# Altium schematic sheet zulu_a7_5.SchDoc
size 277 x 341 mm; Author: Christian Tambe; VERSION#: 1.0; Origin: Eagle; OriginPath: C:\Users\tambe\Documents\Electronics\Zulu_A7\Zulu_Altrium\zulu_a7.sch; OriginSheet: 6; OriginDescription: FPGA Connections
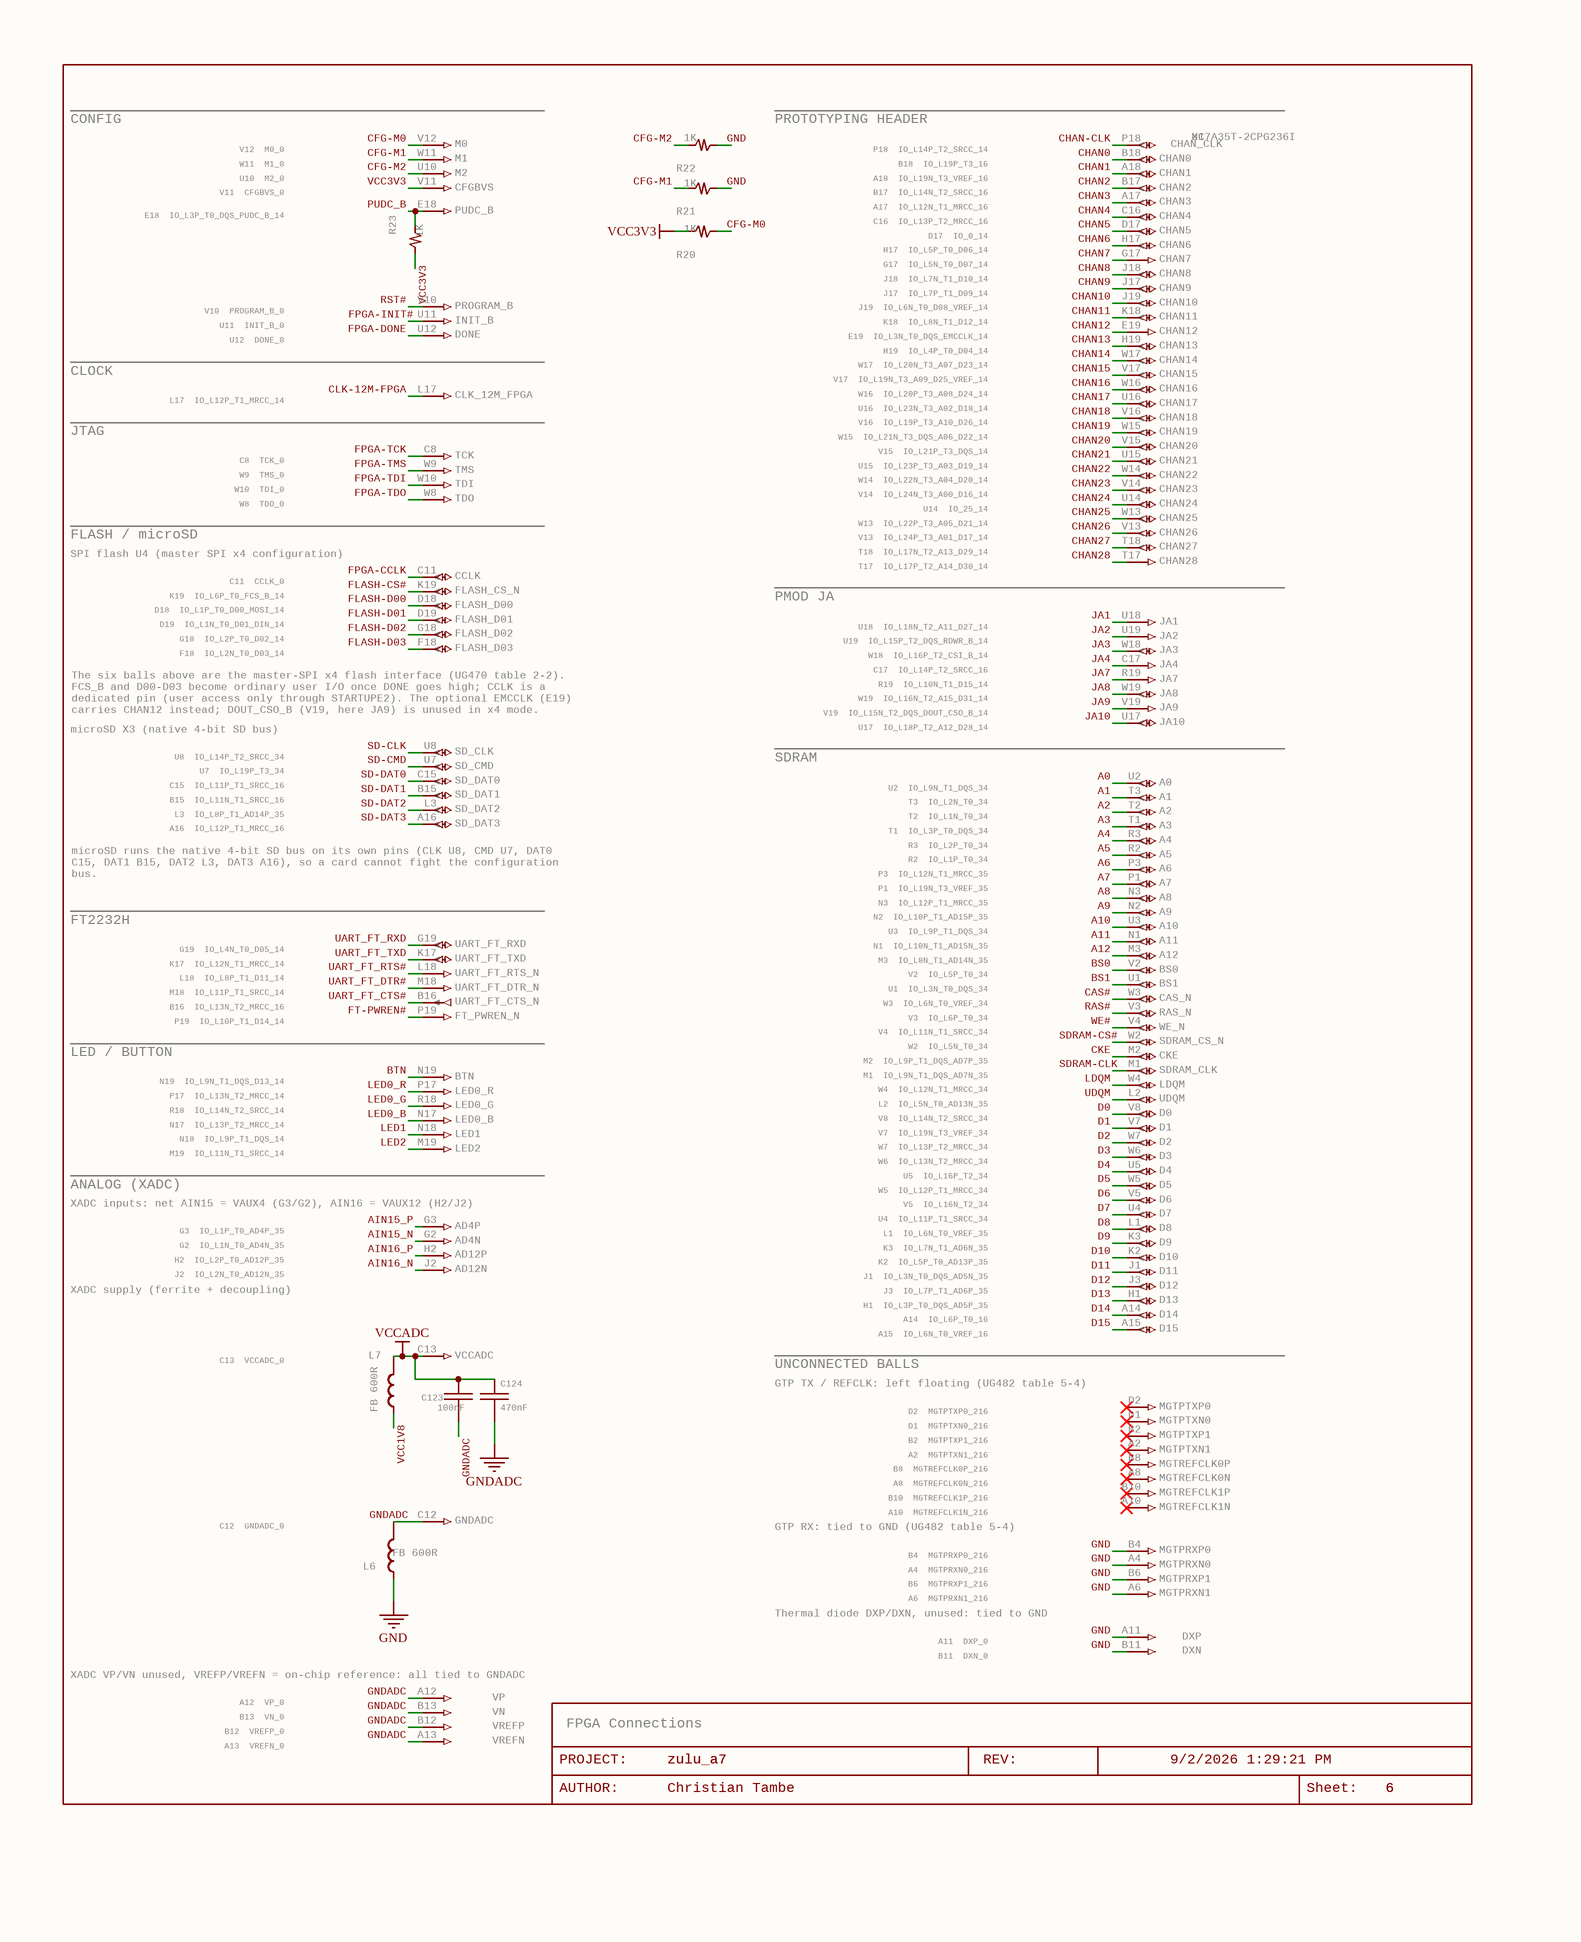
[diagram p0: zulu_a7_5.SchDoc]

## Parts
C123  100nF  [C0201]
C124  470nF  [C0402]
FRAME2  LAST_DATE_TIME: 9/2/2026 1:29:21 PM  Sheet: Sheet:  SHEET: 6  REV: REV:  PROJECT: PROJECT:  DRAWING_NAME: zulu_a7  AUTHOR: Christian Tambe  (hidden comment: DOCFIELD)  (graphical)
L6  FB 600R  [IND0603]
L7  FB 600R  [IND0603]
R20  1K  [R0201]
R21  1K  [R0402]
R22  1K  [R0201]
R23  1K  [R0201]
U1  PART: U1  [XC7A35T-CPG236]  (hidden comment: XC7A35T-2CPG236I)  (parts D,E,F,G,H,I,J,K,L,M,N,O,P,Q,R,S,T,U,V,W,X,Y,Z,27,28,29,30,31,32,33,34,35,36,37,38,39,40,41,42,43,44,45,46,47,48,49,50,51,52,53,54,55,56,57,58,59,60,61,62,63,64,65,66,67,68,69,70,71,72,73,74,75,76,77,78,79,80,81,82,83,84,85,86,87,88,89,90,91,92,93,94,95,96,97,98,99,100,101,102,103,104,105,106,107,108,109,110,111,112,113,114,115,116,117,118,119,120,121,122,123,124,125,126,127,128,129,130,131,132,133,134,135,136,137,138,139,140,141,142 of 142)

## Nets
GND: L6.1 R21.1 R22.1 U1.A4 U1.A6 U1.A11 U1.B4 U1.B6 U1.B11
GNDADC: C123.2 C124.2 L6.2 U1.A12 U1.A13 U1.B12 U1.B13 U1.C12
VCC3V3: R20.2 R23.1 U1.V11
VCCADC: C123.1 C124.1 L7.2 U1.C13
A0: U1.U2
A1: U1.T3
A2: U1.T2
A3: U1.T1
A4: U1.R3
A5: U1.R2
A6: U1.P3
A7: U1.P1
A8: U1.N3
A9: U1.N2
A10: U1.U3
A11: U1.N1
A12: U1.M3
AIN15_N: U1.G2
AIN15_P: U1.G3
AIN16_N: U1.J2
AIN16_P: U1.H2
BS0: U1.V2
BS1: U1.U1
BTN: U1.N19
CAS#: U1.W3
CFG-M0: R20.1 U1.V12
CFG-M1: R21.2 U1.W11
CFG-M2: R22.2 U1.U10
CHAN0: U1.B18
CHAN1: U1.A18
CHAN2: U1.B17
CHAN3: U1.A17
CHAN4: U1.C16
CHAN5: U1.D17
CHAN6: U1.H17
CHAN7: U1.G17
CHAN8: U1.J18
CHAN9: U1.J17
CHAN10: U1.J19
CHAN11: U1.K18
CHAN12: U1.E19
CHAN13: U1.H19
CHAN14: U1.W17
CHAN15: U1.V17
CHAN16: U1.W16
CHAN17: U1.U16
CHAN18: U1.V16
CHAN19: U1.W15
CHAN20: U1.V15
CHAN21: U1.U15
CHAN22: U1.W14
CHAN23: U1.V14
CHAN24: U1.U14
CHAN25: U1.W13
CHAN26: U1.V13
CHAN27: U1.T18
CHAN28: U1.T17
CHAN-CLK: U1.P18
CKE: U1.M2
CLK-12M-FPGA: U1.L17
D0: U1.V8
D1: U1.V7
D2: U1.W7
D3: U1.W6
D4: U1.U5
D5: U1.W5
D6: U1.V5
D7: U1.U4
D8: U1.L1
D9: U1.K3
D10: U1.K2
D11: U1.J1
D12: U1.J3
D13: U1.H1
D14: U1.A14
D15: U1.A15
FLASH-CS#: U1.K19
FLASH-D00: U1.D18
FLASH-D01: U1.D19
FLASH-D02: U1.G18
FLASH-D03: U1.F18
FPGA-CCLK: U1.C11
FPGA-DONE: U1.U12
FPGA-INIT#: U1.U11
FPGA-TCK: U1.C8
FPGA-TDI: U1.W10
FPGA-TDO: U1.W8
FPGA-TMS: U1.W9
FT-PWREN#: U1.P19
JA1: U1.U18
JA2: U1.U19
JA3: U1.W18
JA4: U1.C17
JA7: U1.R19
JA8: U1.W19
JA9: U1.V19
JA10: U1.U17
LDQM: U1.W4
LED0_B: U1.N17
LED0_G: U1.R18
LED0_R: U1.P17
LED1: U1.N18
LED2: U1.M19
PUDC_B: R23.2 U1.E18
RAS#: U1.V3
RST#: U1.V10
SD-CLK: U1.U8
SD-CMD: U1.U7
SD-DAT0: U1.C15
SD-DAT1: U1.B15
SD-DAT2: U1.L3
SD-DAT3: U1.A16
SDRAM-CLK: U1.M1
SDRAM-CS#: U1.W2
UART_FT_CTS#: U1.B16
UART_FT_DTR#: U1.M18
UART_FT_RTS#: U1.L18
UART_FT_RXD: U1.G19
UART_FT_TXD: U1.K17
UDQM: U1.L2
VCC1V8: L7.1
WE#: U1.V4

Not connected (* = marked no-connect by the designer): U1 A2(1)* A8(1)* A10(1)* B2(1)* B8(1)* B10(1)* D1(1)* D2(1)*

## Notes on the sheet
- CONFIG
- V12  M0_0
- W11  M1_0
- U10  M2_0
- PROTOTYPING HEADER
- B18  IO_L19P_T3_16
- A18  IO_L19N_T3_VREF_16
- P18  IO_L14P_T2_SRCC_14
- V11  CFGBVS_0
- E18  IO_L3P_T0_DQS_PUDC_B_14
- B17  IO_L14N_T2_SRCC_16
- A17  IO_L12N_T1_MRCC_16
- C16  IO_L13P_T2_MRCC_16
- D17  IO_0_14
- H17  IO_L5P_T0_D06_14
- V10  PROGRAM_B_0
- J18  IO_L7N_T1_D10_14
- J17  IO_L7P_T1_D09_14
- J19  IO_L6N_T0_D08_VREF_14
- K18  IO_L8N_T1_D12_14
- G17  IO_L5N_T0_D07_14
- CLOCK
- U12  DONE_0
- U11  INIT_B_0
- H19  IO_L4P_T0_D04_14
- W17  IO_L20N_T3_A07_D23_14
- V17  IO_L19N_T3_A09_D25_VREF_14
- W16  IO_L20P_T3_A08_D24_14
- E19  IO_L3N_T0_DQS_EMCCLK_14
- JTAG
- C8  TCK_0
- L17  IO_L12P_T1_MRCC_14
- U16  IO_L23N_T3_A02_D18_14
- V16  IO_L19P_T3_A10_D26_14
- W15  IO_L21N_T3_DQS_A06_D22_14
- V15  IO_L21P_T3_DQS_14
- U15  IO_L23P_T3_A03_D19_14
- W8  TDO_0
- W9  TMS_0
- W10  TDI_0
- W14  IO_L22N_T3_A04_D20_14
- V14  IO_L24N_T3_A00_D16_14
- U14  IO_25_14
- W13  IO_L22P_T3_A05_D21_14
- V13  IO_L24P_T3_A01_D17_14
- FLASH / microSD
- SPI flash U4 (master SPI x4 configuration)
- C11  CCLK_0
- D18  IO_L1P_T0_D00_MOSI_14
- K19  IO_L6P_T0_FCS_B_14
- PMOD JA
- T18  IO_L17N_T2_A13_D29_14
- T17  IO_L17P_T2_A14_D30_14
- D19  IO_L1N_T0_D01_DIN_14
- G18  IO_L2P_T0_D02_14
- F18  IO_L2N_T0_D03_14
- W18  IO_L16P_T2_CSI_B_14
- U18  IO_L18N_T2_A11_D27_14
- U19  IO_L15P_T2_DQS_RDWR_B_14
- C17  IO_L14P_T2_SRCC_16
- R19  IO_L10N_T1_D15_14
- microSD X3 (native 4-bit SD bus)
- (near U1) The six balls above are the master-SPI x4 flash interface (UG470 table 2-2). FCS_B and D00-D03 become ordinary user I/O once DONE goes high; CCLK is a dedicated pin (user access only through STARTUPE2). The optional EMCCLK (E19) carries CHAN12 instead; DOUT_CSO_B (V19, here JA9) is unused in x4 mode.
- W19  IO_L16N_T2_A15_D31_14
- V19  IO_L15N_T2_DQS_DOUT_CSO_B_14
- U17  IO_L18P_T2_A12_D28_14
- L3  IO_L8P_T1_AD14P_35
- B15  IO_L11N_T1_SRCC_16
- U8  IO_L14P_T2_SRCC_34
- U7  IO_L19P_T3_34
- C15  IO_L11P_T1_SRCC_16
- SDRAM
- U2  IO_L9N_T1_DQS_34
- T3  IO_L2N_T0_34
- T2  IO_L1N_T0_34
- A16  IO_L12P_T1_MRCC_16
- P1  IO_L19N_T3_VREF_35
- T1  IO_L3P_T0_DQS_34
- R3  IO_L2P_T0_34
- R2  IO_L1P_T0_34
- P3  IO_L12N_T1_MRCC_35
- FT2232H
- (near U1) microSD runs the native 4-bit SD bus on its own pins (CLK U8, CMD U7, DAT0 C15, DAT1 B15, DAT2 L3, DAT3 A16), so a card cannot fight the configuration bus.
- K17  IO_L12N_T1_MRCC_14
- G19  IO_L4N_T0_D05_14
- U3  IO_L9P_T1_DQS_34
- N3  IO_L12P_T1_MRCC_35
- N2  IO_L10P_T1_AD15P_35
- N1  IO_L10N_T1_AD15N_35
- M3  IO_L8N_T1_AD14N_35
- B16  IO_L13N_T2_MRCC_16
- L18  IO_L8P_T1_D11_14
- M18  IO_L11P_T1_SRCC_14
- P19  IO_L10P_T1_D14_14
- W3  IO_L6N_T0_VREF_34
- V3  IO_L6P_T0_34
- V4  IO_L11N_T1_SRCC_34
- U1  IO_L3N_T0_DQS_34
- V2  IO_L5P_T0_34
- LED / BUTTON
- N19  IO_L9N_T1_DQS_D13_14
- R18  IO_L14N_T2_SRCC_14
- P17  IO_L13N_T2_MRCC_14
- W2  IO_L5N_T0_34
- W4  IO_L12N_T1_MRCC_34
- M1  IO_L9N_T1_DQS_AD7N_35
- L2  IO_L5N_T0_AD13N_35
- M2  IO_L9P_T1_DQS_AD7P_35
- N18  IO_L9P_T1_DQS_14
- M19  IO_L11N_T1_SRCC_14
- N17  IO_L13P_T2_MRCC_14
- V8  IO_L14N_T2_SRCC_34
- V7  IO_L19N_T3_VREF_34
- W7  IO_L13P_T2_MRCC_34
- W6  IO_L13N_T2_MRCC_34
- U5  IO_L16P_T2_34
- ANALOG (XADC)
- XADC inputs: net AIN15 = VAUX4 (G3/G2), AIN16 = VAUX12 (H2/J2)
- G3  IO_L1P_T0_AD4P_35
- G2  IO_L1N_T0_AD4N_35
- W5  IO_L12P_T1_MRCC_34
- V5  IO_L16N_T2_34
- U4  IO_L11P_T1_SRCC_34
- L1  IO_L6N_T0_VREF_35
- K3  IO_L7N_T1_AD6N_35
- XADC supply (ferrite + decoupling)
- H2  IO_L2P_T0_AD12P_35
- J2  IO_L2N_T0_AD12N_35
- K2  IO_L5P_T0_AD13P_35
- J1  IO_L3N_T0_DQS_AD5N_35
- J3  IO_L7P_T1_AD6P_35
- H1  IO_L3P_T0_DQS_AD5P_35
- A14  IO_L6P_T0_16
- C13  VCCADC_0
- UNCONNECTED BALLS
- GTP TX / REFCLK: left floating (UG482 table 5-4)
- A15  IO_L6N_T0_VREF_16
- D2  MGTPTXP0_216
- D1  MGTPTXN0_216
- B2  MGTPTXP1_216
- B8  MGTREFCLK0P_216
- A2  MGTPTXN1_216
- C12  GNDADC_0
- GTP RX: tied to GND (UG482 table 5-4)
- A8  MGTREFCLK0N_216
- B10  MGTREFCLK1P_216
- A10  MGTREFCLK1N_216
- B4  MGTPRXP0_216
- A4  MGTPRXN0_216
- B6  MGTPRXP1_216
- A6  MGTPRXN1_216
- (near U1) XADC VP/VN unused, VREFP/VREFN = on-chip reference: all tied to GNDADC
- Thermal diode DXP/DXN, unused: tied to GND
- A11  DXP_0
- B11  DXN_0
- A12  VP_0
- B13  VN_0
- B12  VREFP_0
- A13  VREFN_0
- (near FRAME2) FPGA Connections
- (near FRAME2) AUTHOR:

## Library data of the parts
C123 = C-USC0201: CAPACITOR, American symbol; GateName_1: G$1; SymbolName_1: C-US; MANF: Murata; MANF#: GRM033R61A104KE15D; SPEC: X5R 10V +-10% 0201 0.1uF, 0.30 mm max -- moved 2026-09-16 from the L7 bead to U1's VCCADC/GNDADC balls: UG480 Fig 6-1 Note 1 puts the 100 nF as close as possible to the package balls, the 470 nF (C124) at the bead; DeviceName: C0201; LibraryName: rcl; DeviceSetName: C-US
C124 = C-USC0402: CAPACITOR, American symbol; GateName_1: G$1; SymbolName_1: C-US; MANF: Samsung; MANF#: CL05A474KO5NNNC; SPEC: X5R 16V +-10% 0402 0.47uF, 0.55 mm max; replaced GRM155R61C474KA88D (a number no distributor knows) on 2026-09-07; DeviceName: C0402; LibraryName: rcl; DeviceSetName: C-US
FRAME2 = DOCFIELD: DOCUMENT FIELD; GateName_1: G$1; SymbolName_1: DOCFIELD; LibraryName: ctambe; DeviceSetName: DOCFIELD
L6 L7 = INDUCTOR: INDUCTOR, generic power inductor; GateName_1: G$1; MANF: Murata; MANF#: BLM18KG601SN1D; SPEC: ferrite bead 600 ohm at 100 MHz +-25%, 1.3 A at 85 C, 0.15 ohm max, 0603, 0.90 mm max; replaced BLM18PG601SN1D (a number Murata never made; the spec 600 ohm/1.5 A is BLM18SP601SN1D) on 2026-09-08; L4/L5 feed the FT2232H VPHY/VPLL (60 mA max), L6 GNDADC, L7 VCCADC (25 mA); SymbolName_1: INDUCTOR; LibraryName: ctambe; DeviceSetName: INDUCTOR
R20 R22 R23 = R-US_SMALLR0201: RESISTOR, American symbol, small 2-zigzag variant (sheet 2 only); GateName_1: G$1; MANF: Yageo; MANF#: RC0201FR-071KL; SPEC: thick film +-1%, 1/20W, 0201; SymbolName_1: R-US_SMALL; DeviceName: R0201; LibraryName: rcl; DeviceSetName: R-US_SMALL
R21 = R-US_SMALLR0402: RESISTOR, American symbol, small 2-zigzag variant (sheet 2 only); GateName_1: G$1; MANF: Yageo; MANF#: RC0402FR-071KL; SPEC: thick film +-1%, 1/16W, 0402; SymbolName_1: R-US_SMALL; DeviceName: R0402; LibraryName: rcl; DeviceSetName: R-US_SMALL
U1 = XC7A35T-CPG236-1CPG236C: Xilinx Artix-7 XC7A35T-2CPG236I   Replacement for the Spartan-6 XC6SLX25-FT256. See design notes: SDRAM/microSD/GPIO ball assignments verified against Digilent Cmod A7-35T (same device+package); config/JTAG/power ball assignments are functionally correct placeholders pending verification against the official Xilinx pinout file.; GateName_1: PWR; SymbolName_1: A7_PWR; GateName_2: GND; SymbolName_2: A7_GND; GateName_3: BANK216; SymbolName_3: A7_BANK216; GateName_4: PART_VALUE; SymbolName_4: PV_GATE; GateName_5: SDRAM_A0; SymbolName_5: PIN_GATE_IO; GateName_6: SDRAM_A1; GateName_7: SDRAM_A2; GateName_8: SDRAM_A3; GateName_9: SDRAM_A4; GateName_10: SDRAM_A5; GateName_11: SDRAM_A6; GateName_12: SDRAM_A7; GateName_13: SDRAM_A8; GateName_14: SDRAM_A9; GateName_15: SDRAM_A10; GateName_16: SDRAM_A11; GateName_17: SDRAM_A12; GateName_18: SDRAM_BA0; GateName_19: SDRAM_BA1; GateName_20: SDRAM_CAS#; GateName_21: SDRAM_RAS#; GateName_22: SDRAM_WE#; GateName_23: SDRAM_CS#; GateName_24: SDRAM_CKE; GateName_25: SDRAM_CLK; GateName_26: SDRAM_LDQM; GateName_27: SDRAM_UDQM; GateName_28: SDRAM_DQ0; GateName_29: SDRAM_DQ1; GateName_30: SDRAM_DQ2; GateName_31: SDRAM_DQ3; GateName_32: SDRAM_DQ4; GateName_33: SDRAM_DQ5; GateName_34: SDRAM_DQ6; GateName_35: SDRAM_DQ7; GateName_36: SDRAM_DQ8; GateName_37: SDRAM_DQ9; GateName_38: SDRAM_DQ10; GateName_39: SDRAM_DQ11; GateName_40: SDRAM_DQ12; GateName_41: SDRAM_DQ13; GateName_42: SDRAM_DQ14; GateName_43: SDRAM_DQ15; GateName_44: SPI_SPI_CCLK; GateName_45: SPI_D00_MOSI; GateName_46: SPI_D01_DIN; GateName_47: SPI_FCS_B; GateName_48: SD_DAT3; GateName_49: SD_DAT2; GateName_50: SD_DAT1; GateName_51: CHAN0; GateName_52: CHAN1; GateName_53: CHAN2; GateName_54: CHAN3; GateName_55: CHAN4; GateName_56: CHAN5; GateName_57: CHAN6; GateName_58: CHAN7; GateName_59: CHAN8; GateName_60: CHAN9; GateName_61: CHAN10; GateName_62: CHAN11; GateName_63: IO_W7; GateName_64: CHAN12; GateName_65: CHAN13; GateName_66: CHAN14; GateName_67: CHAN15; GateName_68: CHAN16; GateName_69: CHAN17; GateName_70: CHAN18; GateName_71: CHAN19; GateName_72: CHAN20; GateName_73: CHAN21; GateName_74: CHAN22; GateName_75: CHAN23; GateName_76: CHAN24; GateName_77: CHAN25; GateName_78: CHAN26; GateName_79: CHAN27; GateName_80: UART_CTS; SymbolName_80: PIN_GATE_OUT; GateName_81: CHAN-CLK; GateName_82: XADC_P; SymbolName_82: PIN_GATE_IN; GateName_83: USB_PWREN; GateName_84: XADC_N; GateName_85: CLK12M; GateName_86: UART_TXD; GateName_87: UART_RXD; GateName_88: PROGRAM_B; GateName_89: INIT_B; GateName_90: DONE; GateName_91: TCK; GateName_92: TMS; GateName_93: TDI; GateName_94: TDO; GateName_95: M0; GateName_96: M1; GateName_97: M2; GateName_98: CFGBVS; GateName_99: PUDC_B; GateName_100: MGTPRXP0; GateName_101: MGTPRXN0; GateName_102: MGTPRXP1; GateName_103: MGTPRXN1; GateName_104: GNDADC; GateName_105: VCCADC; GateName_106: VP; GateName_107: VN; GateName_108: VREFP; GateName_109: VREFN; GateName_110: DXP; GateName_111: DXN; GateName_112: MGTPTXP0; GateName_113: MGTPTXN0; GateName_114: MGTPTXP1; GateName_115: MGTREFCLK0P; GateName_116: MGTREFCLK0N; GateName_117: MGTREFCLK1P; GateName_118: MGTREFCLK1N; GateName_119: MGTPTXN1; GateName_120: CHAN28; GateName_121: LED2; GateName_122: LED0_R; GateName_123: IO_A14; GateName_124: IO_A15; GateName_125: IO_A16; GateName_126: LED1; GateName_127: BTN; GateName_128: SD_DAT0; GateName_129: LED0_G; GateName_130: IO_W19; GateName_131: LED0_B; GateName_132: IO_C15; GateName_133: IO_B15; GateName_134: SD_CLK; GateName_135: UART_RTS; GateName_136: IO_N2; GateName_137: SD_CMD; GateName_138: UART_DTR; GateName_139: SPI_D03; GateName_140: SPI_D02; GateName_141: XADC1_P; GateName_142: XADC1_N; MANF: AMD/Xilinx; SymbolName_6: PIN_GATE_IO; SymbolName_7: PIN_GATE_IO; SymbolName_8: PIN_GATE_IO; SymbolName_9: PIN_GATE_IO; SymbolName_10: PIN_GATE_IO; SymbolName_11: PIN_GATE_IO; SymbolName_12: PIN_GATE_IO; SymbolName_13: PIN_GATE_IO; SymbolName_14: PIN_GATE_IO; SymbolName_15: PIN_GATE_IO; SymbolName_16: PIN_GATE_IO; SymbolName_17: PIN_GATE_IO; SymbolName_18: PIN_GATE_IO; SymbolName_19: PIN_GATE_IO; SymbolName_20: PIN_GATE_IO; SymbolName_21: PIN_GATE_IO; SymbolName_22: PIN_GATE_IO; SymbolName_23: PIN_GATE_IO; SymbolName_24: PIN_GATE_IO; SymbolName_25: PIN_GATE_IO; SymbolName_26: PIN_GATE_IO; SymbolName_27: PIN_GATE_IO; SymbolName_28: PIN_GATE_IO; SymbolName_29: PIN_GATE_IO; SymbolName_30: PIN_GATE_IO; SymbolName_31: PIN_GATE_IO; SymbolName_32: PIN_GATE_IO; SymbolName_33: PIN_GATE_IO; SymbolName_34: PIN_GATE_IO; SymbolName_35: PIN_GATE_IO; SymbolName_36: PIN_GATE_IO; SymbolName_37: PIN_GATE_IO; SymbolName_38: PIN_GATE_IO; SymbolName_39: PIN_GATE_IO; SymbolName_40: PIN_GATE_IO; SymbolName_41: PIN_GATE_IO; SymbolName_42: PIN_GATE_IO; SymbolName_43: PIN_GATE_IO; SymbolName_44: PIN_GATE_IO; SymbolName_45: PIN_GATE_IO; SymbolName_46: PIN_GATE_IO; SymbolName_47: PIN_GATE_IO; SymbolName_48: PIN_GATE_IO; SymbolName_49: PIN_GATE_IO; SymbolName_50: PIN_GATE_IO; SymbolName_51: PIN_GATE_IO; SymbolName_52: PIN_GATE_IO; SymbolName_53: PIN_GATE_IO; SymbolName_54: PIN_GATE_IO; SymbolName_55: PIN_GATE_IO; SymbolName_56: PIN_GATE_IO; SymbolName_57: PIN_GATE_IO; SymbolName_58: PIN_GATE_IO; SymbolName_59: PIN_GATE_IO; SymbolName_60: PIN_GATE_IO; SymbolName_61: PIN_GATE_IO; SymbolName_62: PIN_GATE_IO; SymbolName_63: PIN_GATE_IO; SymbolName_64: PIN_GATE_IO; SymbolName_65: PIN_GATE_IO; SymbolName_66: PIN_GATE_IO; SymbolName_67: PIN_GATE_IO; SymbolName_68: PIN_GATE_IO; SymbolName_69: PIN_GATE_IO; SymbolName_70: PIN_GATE_IO; SymbolName_71: PIN_GATE_IO; SymbolName_72: PIN_GATE_IO; SymbolName_73: PIN_GATE_IO; SymbolName_74: PIN_GATE_IO; SymbolName_75: PIN_GATE_IO; SymbolName_76: PIN_GATE_IO; SymbolName_77: PIN_GATE_IO; SymbolName_78: PIN_GATE_IO; SymbolName_79: PIN_GATE_IO; SymbolName_81: PIN_GATE_IO; SymbolName_83: PIN_GATE_IN; SymbolName_84: PIN_GATE_IN; SymbolName_85: PIN_GATE_IN; SymbolName_86: PIN_GATE_IO; SymbolName_87: PIN_GATE_IO; SymbolName_88: PIN_GATE_IN; SymbolName_89: PIN_GATE_IN; SymbolName_90: PIN_GATE_IN; SymbolName_91: PIN_GATE_IN; SymbolName_92: PIN_GATE_IN; SymbolName_93: PIN_GATE_IN; SymbolName_94: PIN_GATE_IN; SymbolName_95: PIN_GATE_IN; SymbolName_96: PIN_GATE_IN; SymbolName_97: PIN_GATE_IN; SymbolName_98: PIN_GATE_IN; SymbolName_99: PIN_GATE_IN; SymbolName_100: PIN_GATE_IN; SymbolName_101: PIN_GATE_IN; SymbolName_102: PIN_GATE_IN; SymbolName_103: PIN_GATE_IN; SymbolName_104: PIN_GATE_IN; SymbolName_105: PIN_GATE_IN; SymbolName_106: PIN_GATE_IN; SymbolName_107: PIN_GATE_IN; SymbolName_108: PIN_GATE_IN; SymbolName_109: PIN_GATE_IN; SymbolName_110: PIN_GATE_IN; SymbolName_111: PIN_GATE_IN; SymbolName_112: PIN_GATE_IN; SymbolName_113: PIN_GATE_IN; SymbolName_114: PIN_GATE_IN; SymbolName_115: PIN_GATE_IN; SymbolName_116: PIN_GATE_IN; SymbolName_117: PIN_GATE_IN; SymbolName_118: PIN_GATE_IN; SymbolName_119: PIN_GATE_IN; SymbolName_120: PIN_GATE_IN; SymbolName_121: PIN_GATE_IN; SymbolName_122: PIN_GATE_IN; SymbolName_123: PIN_GATE_IN; SymbolName_124: PIN_GATE_IN; SymbolName_125: PIN_GATE_IN; SymbolName_126: PIN_GATE_IN; SymbolName_127: PIN_GATE_IN; SymbolName_128: PIN_GATE_IO; SymbolName_129: PIN_GATE_IN; SymbolName_130: PIN_GATE_IN; SymbolName_131: PIN_GATE_IN; SymbolName_132: PIN_GATE_IN; SymbolName_133: PIN_GATE_IN; SymbolName_134: PIN_GATE_IO; SymbolName_135: PIN_GATE_IN; SymbolName_136: PIN_GATE_IN; SymbolName_137: PIN_GATE_IO; SymbolName_138: PIN_GATE_IN; SymbolName_139: PIN_GATE_IO; SymbolName_140: PIN_GATE_IO; SymbolName_141: PIN_GATE_IN; SymbolName_142: PIN_GATE_IN; DeviceName: -2CPG236I; LibraryName: ctambe; DeviceSetName: XC7A35T-CPG236; MANF#: XC7A35T-2CPG236I